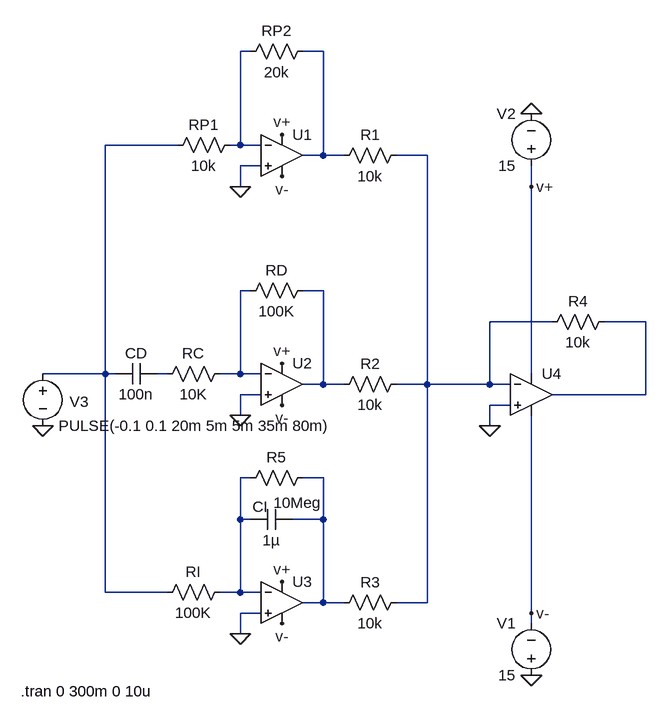
[diagram p0: schematic project.asc]
project.asc, the LTspice schematic file:
Version 4
SHEET 1 3076 1684
WIRE 1488 32 1472 32
WIRE 1600 32 1568 32
WIRE 1376 176 1264 176
WIRE 1472 176 1472 32
WIRE 1472 176 1456 176
WIRE 1504 176 1472 176
WIRE 1600 192 1600 32
WIRE 1600 192 1568 192
WIRE 1632 192 1600 192
WIRE 1760 192 1712 192
WIRE 1504 208 1472 208
WIRE 1472 240 1472 208
WIRE 1920 240 1920 208
WIRE 1488 400 1472 400
WIRE 1600 400 1568 400
WIRE 1952 448 1856 448
WIRE 2096 448 2032 448
WIRE 1264 528 1264 176
WIRE 1264 528 1168 528
WIRE 1280 528 1264 528
WIRE 1360 528 1344 528
WIRE 1472 528 1472 400
WIRE 1472 528 1440 528
WIRE 1504 528 1472 528
WIRE 1920 528 1920 240
WIRE 1600 544 1600 400
WIRE 1600 544 1568 544
WIRE 1632 544 1600 544
WIRE 1760 544 1760 192
WIRE 1760 544 1712 544
WIRE 1856 544 1856 448
WIRE 1856 544 1760 544
WIRE 1888 544 1856 544
WIRE 1504 560 1472 560
WIRE 2096 560 2096 448
WIRE 2096 560 1952 560
WIRE 1888 576 1856 576
WIRE 1472 592 1472 560
WIRE 1856 608 1856 576
WIRE 1488 688 1472 688
WIRE 1600 688 1568 688
WIRE 1472 752 1472 688
WIRE 1488 752 1472 752
WIRE 1600 752 1600 688
WIRE 1600 752 1552 752
WIRE 1264 864 1264 528
WIRE 1360 864 1264 864
WIRE 1472 864 1472 752
WIRE 1472 864 1440 864
WIRE 1504 864 1472 864
WIRE 1600 880 1600 752
WIRE 1600 880 1568 880
WIRE 1632 880 1600 880
WIRE 1760 880 1760 544
WIRE 1760 880 1712 880
WIRE 1504 896 1472 896
WIRE 1920 896 1920 592
WIRE 1920 912 1920 896
WIRE 1472 928 1472 896
FLAG 1920 992 0
FLAG 1920 128 0
FLAG 1920 240 v+
FLAG 1536 512 v+
FLAG 1536 848 v+
FLAG 1536 160 v+
FLAG 1920 896 v-
FLAG 1536 912 v-
FLAG 1536 576 v-
FLAG 1536 224 v-
FLAG 1472 240 0
FLAG 1472 592 0
FLAG 1472 928 0
FLAG 1856 608 0
FLAG 1168 608 0
SYMBOL OpAmps\\UniversalOpamp2 1536 192 R0
SYMATTR InstName U1
SYMBOL OpAmps\\UniversalOpamp2 1536 544 R0
SYMATTR InstName U2
SYMBOL OpAmps\\UniversalOpamp2 1536 880 R0
SYMATTR InstName U3
SYMBOL OpAmps\\UniversalOpamp2 1920 560 R0
SYMATTR InstName U4
SYMBOL voltage 1920 1008 R180
WINDOW 0 24 96 Left 2
WINDOW 3 24 16 Left 2
SYMATTR InstName V1
SYMATTR Value 15
SYMBOL voltage 1920 224 R180
WINDOW 0 24 96 Left 2
WINDOW 3 24 16 Left 2
SYMATTR InstName V2
SYMATTR Value 15
SYMBOL voltage 1168 512 R0
WINDOW 0 41 59 Left 2
SYMATTR InstName V3
SYMATTR Value PULSE(-0.1 0.1 20m 5m 5m 35m 80m)
SYMBOL res 1728 176 R90
WINDOW 0 0 56 VBottom 2
WINDOW 3 32 56 VTop 2
SYMATTR InstName R1
SYMATTR Value 10k
SYMBOL res 1728 528 R90
WINDOW 0 0 56 VBottom 2
WINDOW 3 32 56 VTop 2
SYMATTR InstName R2
SYMATTR Value 10k
SYMBOL res 1728 864 R90
WINDOW 0 0 56 VBottom 2
WINDOW 3 32 56 VTop 2
SYMATTR InstName R3
SYMATTR Value 10k
SYMBOL res 2048 432 R90
WINDOW 0 0 56 VBottom 2
WINDOW 3 32 56 VTop 2
SYMATTR InstName R4
SYMATTR Value 10k
SYMBOL res 1584 16 R90
WINDOW 0 0 56 VBottom 2
WINDOW 3 32 56 VTop 2
SYMATTR InstName RP2
SYMATTR Value 20k
SYMBOL res 1584 384 R90
WINDOW 0 0 56 VBottom 2
WINDOW 3 32 56 VTop 2
SYMATTR InstName RD
SYMATTR Value 100K
SYMBOL cap 1552 736 R90
WINDOW 0 12 49 VBottom 2
WINDOW 3 32 32 VTop 2
SYMATTR InstName CI
SYMATTR Value 1µ
SYMATTR Value2 ic=0
SYMBOL res 1472 160 R90
WINDOW 0 0 56 VBottom 2
WINDOW 3 32 56 VTop 2
SYMATTR InstName RP1
SYMATTR Value 10k
SYMBOL res 1456 512 R90
WINDOW 0 0 56 VBottom 2
WINDOW 3 32 56 VTop 2
SYMATTR InstName RC
SYMATTR Value 10K
SYMBOL res 1456 848 R90
WINDOW 0 0 56 VBottom 2
WINDOW 3 32 56 VTop 2
SYMATTR InstName RI
SYMATTR Value 100K
SYMBOL cap 1344 512 R90
WINDOW 0 0 32 VBottom 2
WINDOW 3 32 32 VTop 2
SYMATTR InstName CD
SYMATTR Value 100n
SYMBOL res 1584 672 R90
WINDOW 0 0 56 VBottom 2
WINDOW 3 39 24 VTop 2
SYMATTR InstName R5
SYMATTR Value 10Meg
TEXT 1134 1016 Left 2 !.tran 0 300m 0 10u

The netlist it stands for:
* project.asc
XU1 0 N001 v+ v- N002 level.2 Avol=1Meg GBW=10Meg Slew=10Meg ilimit=25m rail=0 Vos=0 phimargin=45 en=0 enk=0 in=0 ink=0 Rin=500Meg  ; pins IN+ IN- V+ V- OUT
XU2 0 N005 v+ v- N006 level.2 Avol=1Meg GBW=10Meg Slew=10Meg ilimit=25m rail=0 Vos=0 phimargin=45 en=0 enk=0 in=0 ink=0 Rin=500Meg  ; pins IN+ IN- V+ V- OUT
XU3 0 N009 v+ v- N010 level.2 Avol=1Meg GBW=10Meg Slew=10Meg ilimit=25m rail=0 Vos=0 phimargin=45 en=0 enk=0 in=0 ink=0 Rin=500Meg  ; pins IN+ IN- V+ V- OUT
XU4 0 N004 v+ v- N007 level.2 Avol=1Meg GBW=10Meg Slew=10Meg ilimit=25m rail=0 Vos=0 phimargin=45 en=0 enk=0 in=0 ink=0 Rin=500Meg  ; pins IN+ IN- V+ V- OUT
V1 0 v- 15
V2 v+ 0 15
V3 N003 0 PULSE(-0.1 0.1 20m 5m 5m 35m 80m)
R1 N004 N002 10k
R2 N004 N006 10k
R3 N004 N010 10k
R4 N007 N004 10k
RP2 N002 N001 20k
RD N006 N005 100K
CI N010 N009 1µ ic=0
RP1 N001 N003 10k
RC N005 N008 10K
RI N009 N003 100K
CD N008 N003 100n
R5 N010 N009 10Meg
.tran 0 300m 0 10u
.lib UniversalOpamps2.sub
.backanno
.end